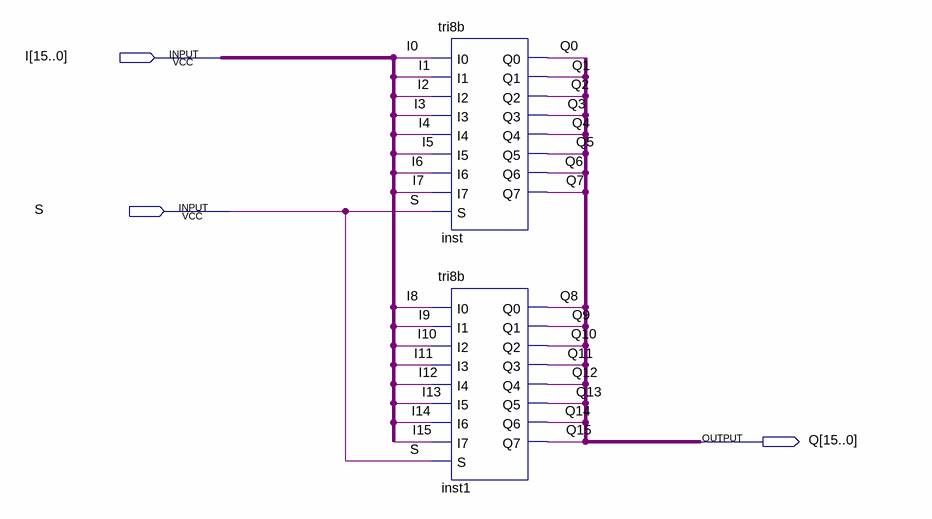
[diagram p0: schematic sheet]
// Quartus schematic tri16b.bdf as structural Verilog: 2 symbols, 3 pins
module tri16b (
  input  [15:0] I,
  input  S,
  output [15:0] Q
);

  tri8b inst (
    .I0(I[0]), .I1(I[1]), .I2(I[2]), .I3(I[3]), .I4(I[4]), .I5(I[5]), .I6(I[6]), .I7(I[7]), .S(S), .Q0(Q[0]),
    .Q1(Q[1]), .Q2(Q[2]), .Q3(Q[3]), .Q4(Q[4]), .Q5(Q[5]), .Q6(Q[6]), .Q7(Q[7]));
  tri8b inst1 (
    .I0(I[8]), .I1(I[9]), .I2(I[10]), .I3(I[11]), .I4(I[12]), .I5(I[13]), .I6(I[14]), .I7(I[15]), .S(S),
    .Q0(Q[8]), .Q1(Q[9]), .Q2(Q[10]), .Q3(Q[11]), .Q4(Q[12]), .Q5(Q[13]), .Q6(Q[14]), .Q7(Q[15]));
endmodule
